# EAGLE design xport-v92-linetestset (EAGLE 9.6.2)
Isolated Line Test Set: A lineman's test handset: polarity-independent, line powered, with an isolated 600:600 wet transformer and switchable TALK / MONITOR loading.
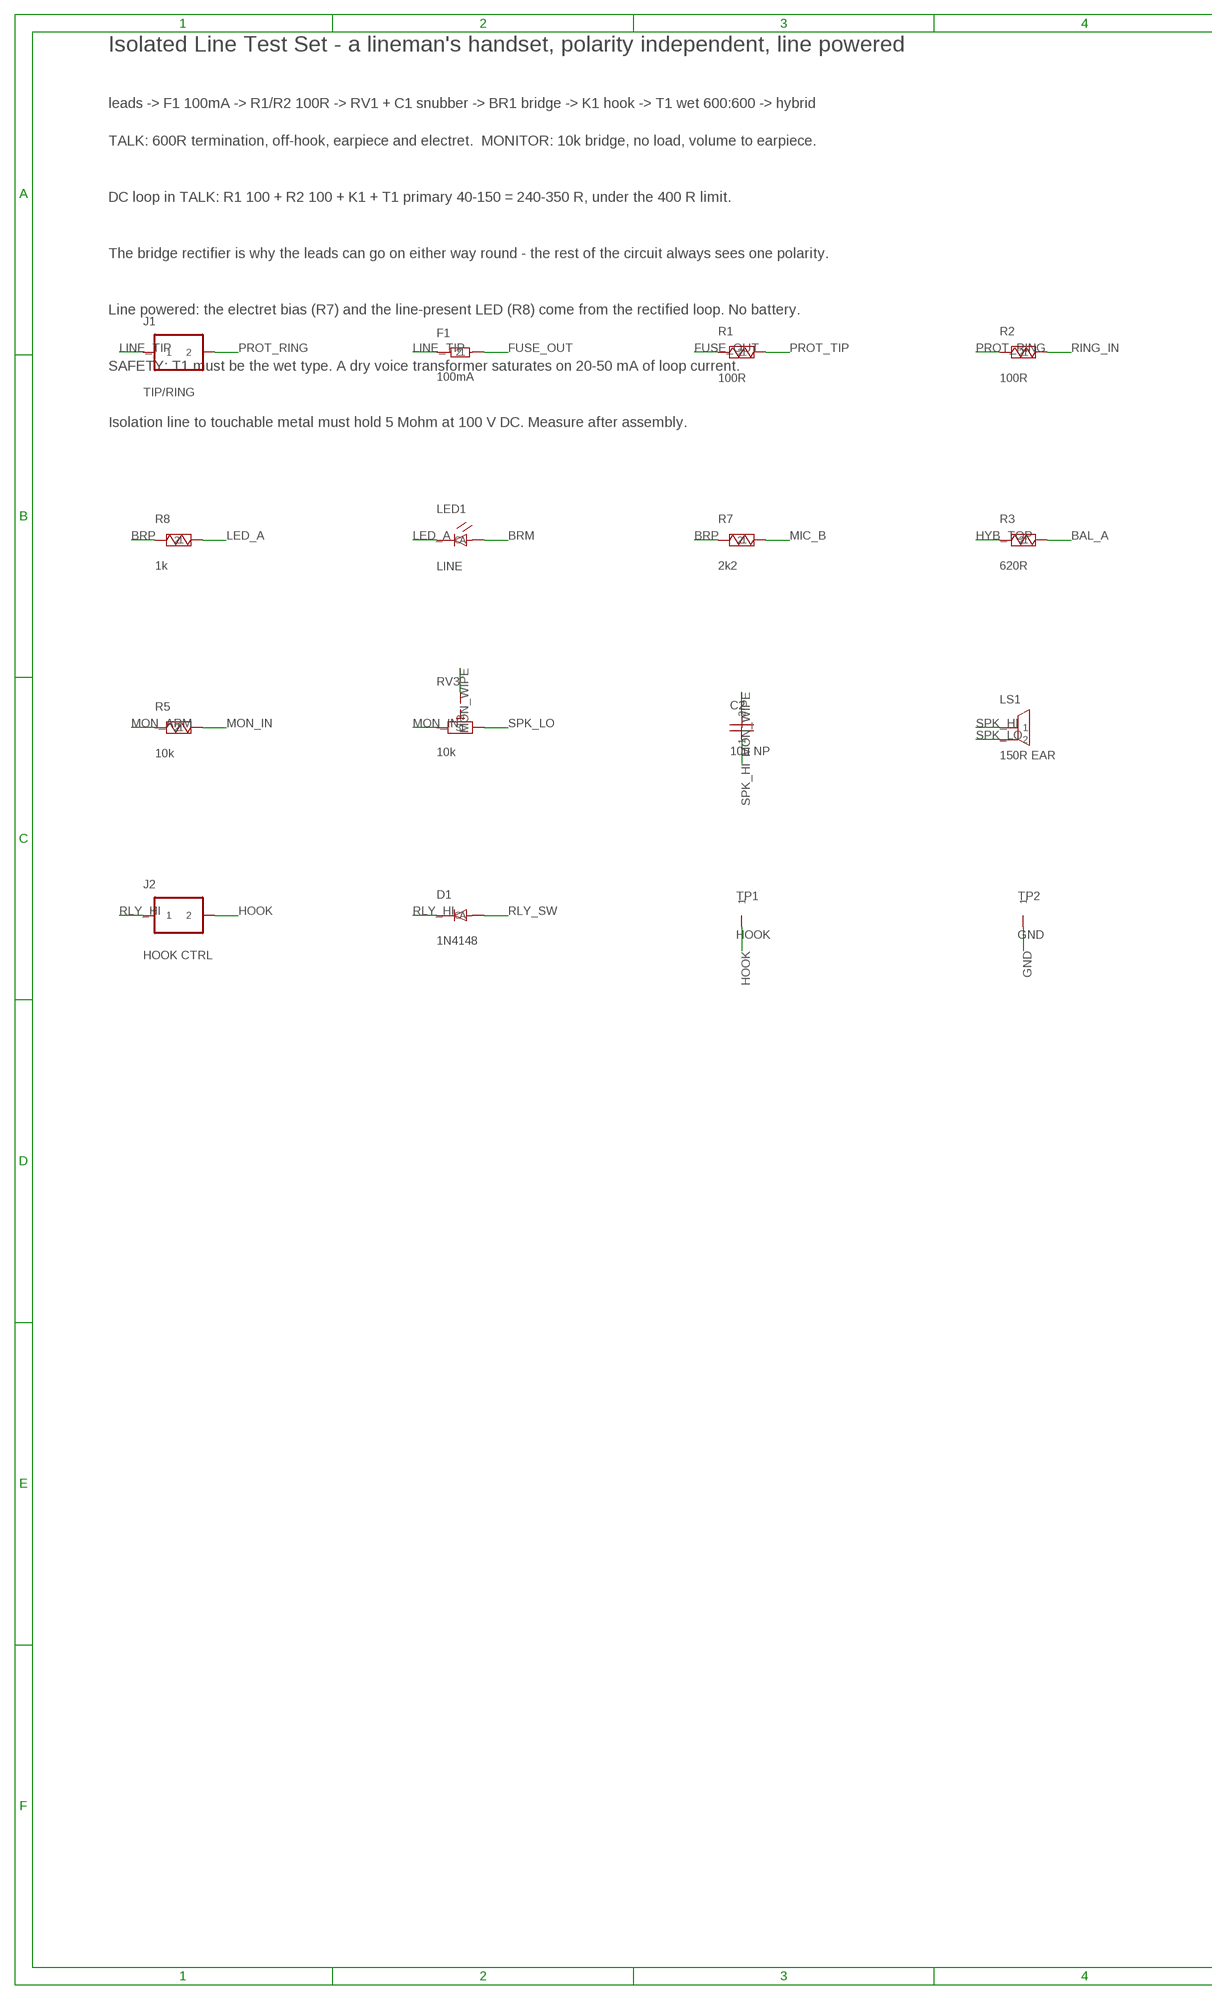
[diagram p0: schematic, sheet 1, part 1 of 2]
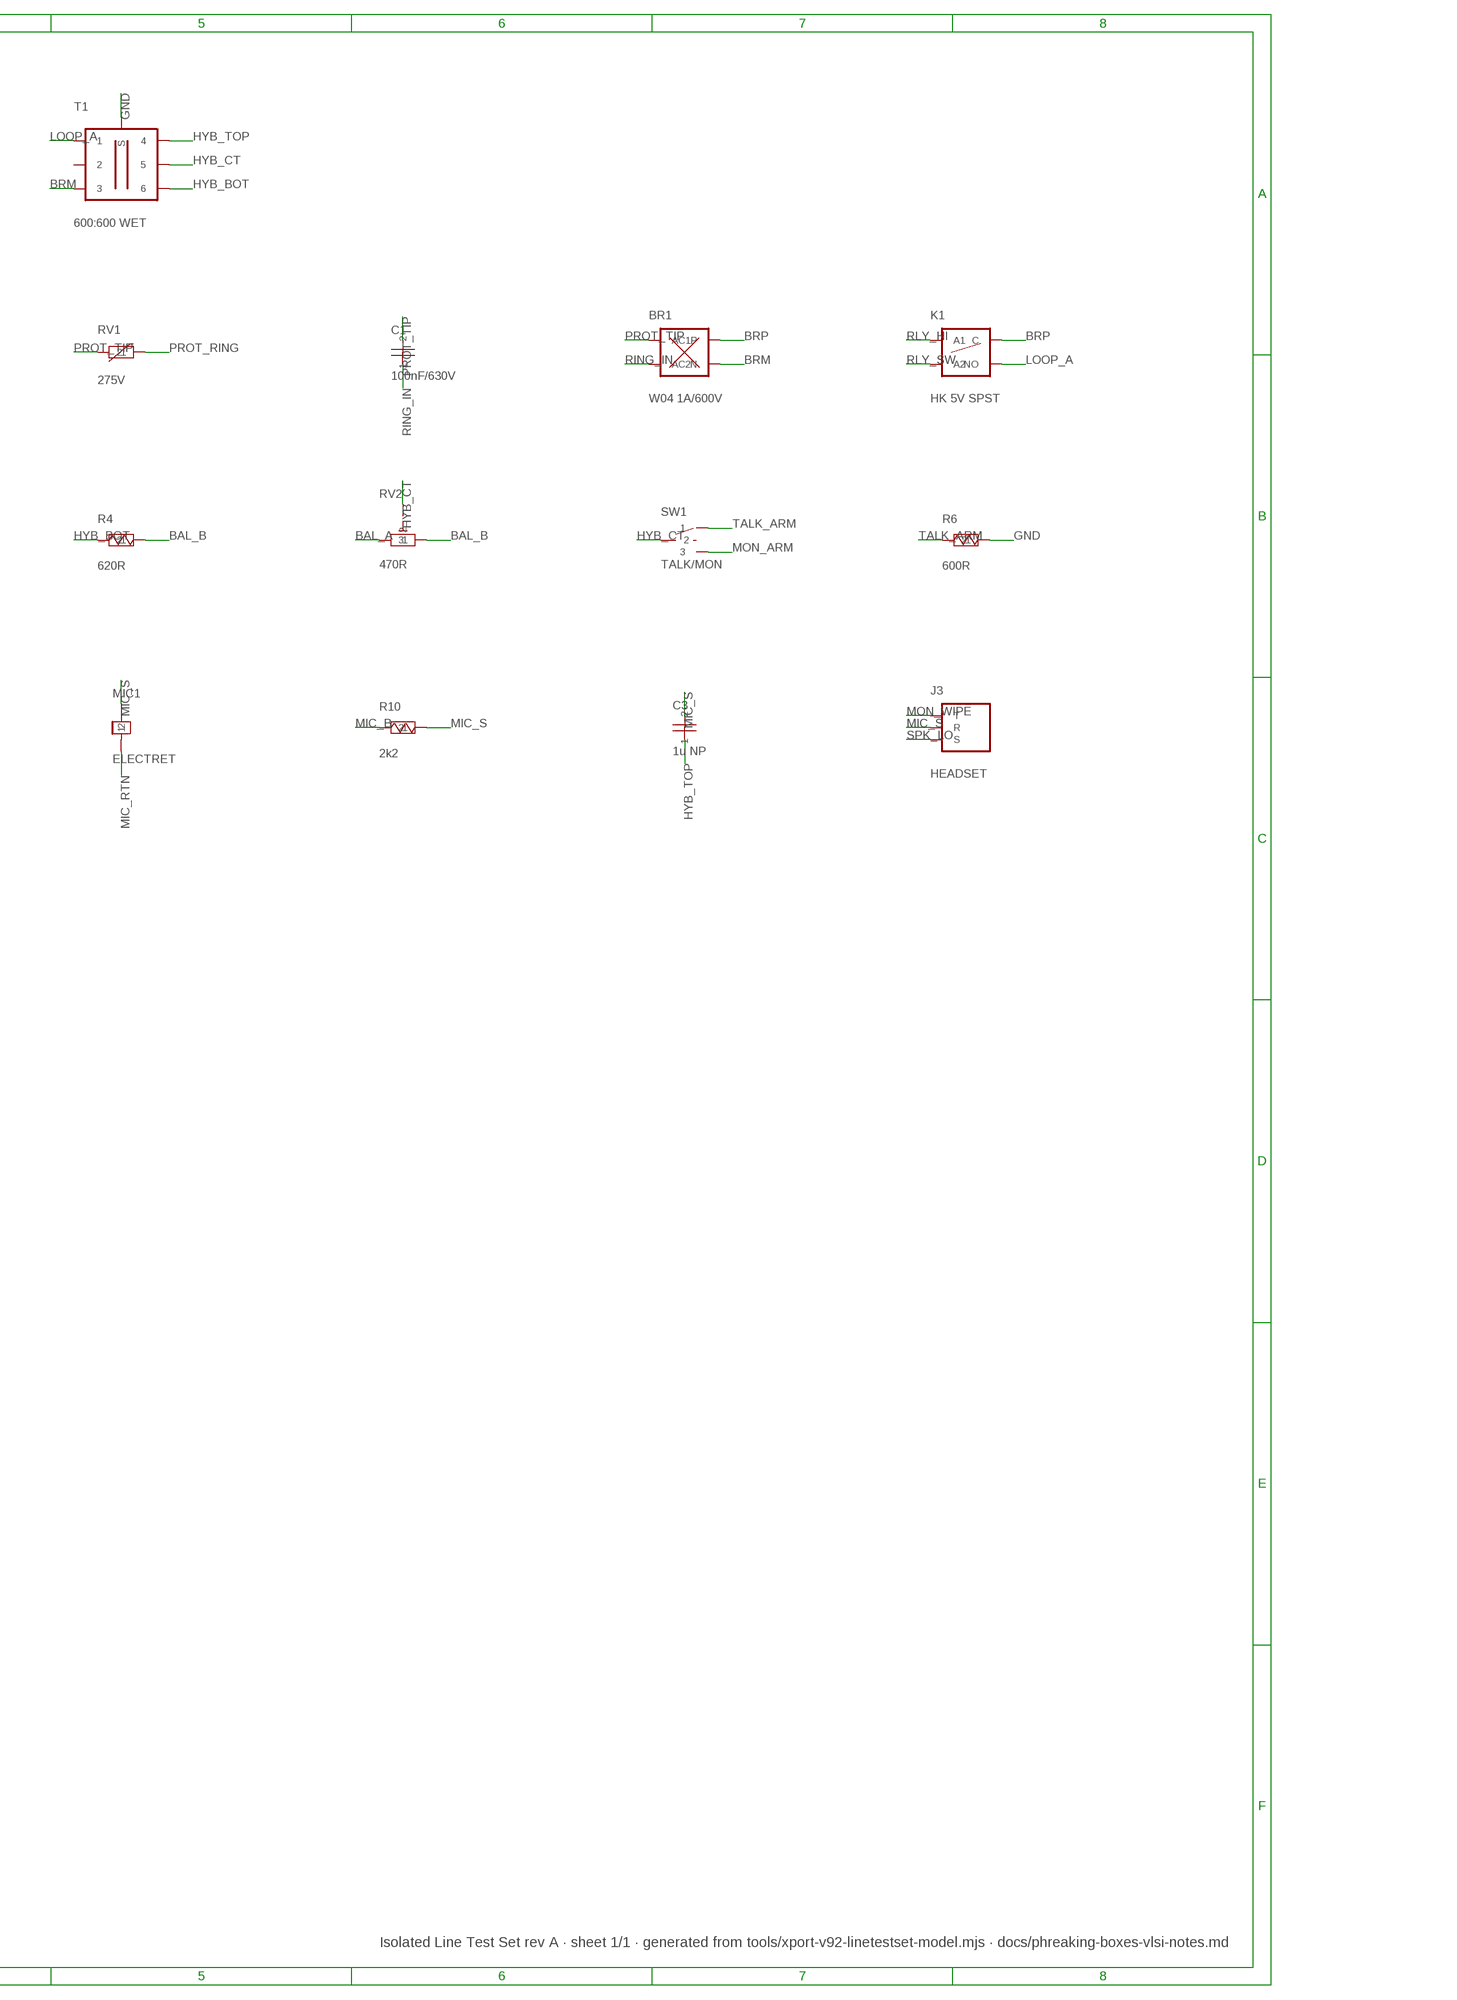
[diagram p1: schematic, sheet 1, part 2 of 2]

## Parts
BR1  W04 1A/600V  BRIDGE  [BRIDGE-WOB]
C1  100nF/630V  C-EU  [C-5.08]
C2  10u NP  C-EU  [C-5.08]
C3  1u NP  C-EU  [C-5.08]
D1  1N4148  DIODE-SCH  [DO41]
F1  100mA  FUSE  [R-7.62]
J1  TIP/RING  TERM-2  [TERM2-5.08]
J2  HOOK CTRL  TERM-2  [TERM2-5.08]
J3  HEADSET  JACK-TRS  [JACK-3P5]
K1  HK 5V SPST  RELAY  [RELAY-SPST]
LED1  LINE  LED  [LED-5MM]
LS1  150R EAR  SPEAKER  [SPEAKER-12]
MIC1  ELECTRET  [ELECTRET-10]
R1  100R  R-EU  [R-7.62]
R2  100R  R-EU  [R-7.62]
R3  620R  R-EU  [R-7.62]
R4  620R  R-EU  [R-7.62]
R5  10k  R-EU  [R-7.62]
R6  600R  R-EU  [R-7.62]
R7  2k2  R-EU  [R-7.62]
R8  1k  R-EU  [R-7.62]
R10  2k2  R-EU  [R-7.62]
RV1  275V  VARISTOR  [MOV-7.62]
RV2  470R  TRIM  [TRIM-3P]
RV3  10k  TRIM  [TRIM-3P]
SW1  TALK/MON  SW-SPDT  [TOGGLE-SPDT]
T1  600:600 WET  XFMR-600  [XFMR-600]
TP1  HOOK  TP  [TP]
TP2  GND  TP  [TP]

## Nets
BAL_A: R3.2 RV2.1
BAL_B: R4.2 RV2.3
BRM: BR1.-(N) LED1.2(C) T1.3
BRP: BR1.+(P) K1.3(C) R7.1 R8.1
FUSE_OUT: F1.2 R1.1
GND: R6.2 T1.S TP2.1
HOOK: J2.2 TP1.1
HYB_BOT: R4.1 T1.6
HYB_CT: RV2.2 SW1.2 T1.5
HYB_TOP: C3.2 R3.1 T1.4
LED_A: LED1.1(A) R8.2
LINE_TIP: F1.1 J1.1
LOOP_A: K1.4(NO) T1.1
MIC_B: R7.2 R10.1
MIC_RTN: MIC1.2
MIC_S: C3.1 J3.2(R) MIC1.1 R10.2
MON_ARM: R5.1 SW1.3
MON_IN: R5.2 RV3.1
MON_WIPE: C2.1 J3.1(T) RV3.2
PROT_RING: J1.2 R2.1 RV1.2
PROT_TIP: BR1.~1(AC1) C1.1 R1.2 RV1.1
RING_IN: BR1.~2(AC2) C1.2 R2.2
RLY_HI: D1.1(A) J2.1 K1.1(A1)
RLY_SW: D1.2(C) K1.2(A2)
SPK_HI: C2.2 LS1.1
SPK_LO: J3.3(S) LS1.2 RV3.3
TALK_ARM: R6.1 SW1.1
Unconnected: T1.2

## Notes on the sheet
- Isolated Line Test Set - a lineman's handset, polarity independent, line powered
- leads -> F1 100mA -> R1/R2 100R -> RV1 + C1 snubber -> BR1 bridge -> K1 hook -> T1 wet 600:600 -> hybrid
- TALK: 600R termination, off-hook, earpiece and electret.  MONITOR: 10k bridge, no load, volume to earpiece.
- DC loop in TALK: R1 100 + R2 100 + K1 + T1 primary 40-150 = 240-350 R, under the 400 R limit.
- The bridge rectifier is why the leads can go on either way round - the rest of the circuit always sees one polarity.
- Line powered: the electret bias (R7) and the line-present LED (R8) come from the rectified loop. No battery.
- SAFETY: T1 must be the wet type. A dry voice transformer saturates on 20-50 mA of loop current.
- Isolation line to touchable metal must hold 5 Mohm at 100 V DC. Measure after assembly.
- Isolated Line Test Set rev A · sheet 1/1 · generated from tools/xport-v92-linetestset-model.mjs · docs/phreaking-boxes-vlsi-notes.md

## Library data of the parts
BR1 = xport-v92-linetestset:BRIDGE
C1-C3 = xport-v92-linetestset:C-EU
D1 = xport-v92-linetestset:DIODE-SCH
F1 = xport-v92-linetestset:FUSE
J1 J2 = xport-v92-linetestset:TERM-2
J3 = xport-v92-linetestset:JACK-TRS
K1 = xport-v92-linetestset:RELAY
LED1 = xport-v92-linetestset:LED
LS1 = xport-v92-linetestset:SPEAKER
MIC1 = xport-v92-linetestset:ELECTRET
R1-R8 R10 = xport-v92-linetestset:R-EU
RV1 = xport-v92-linetestset:VARISTOR
RV2 RV3 = xport-v92-linetestset:TRIM
SW1 = xport-v92-linetestset:SW-SPDT
T1 = xport-v92-linetestset:XFMR-600
TP1 TP2 = xport-v92-linetestset:TP

## Net classes
0 default: width 0.305 mm
1 mains: width 2.5 mm, clearance 3 mm to class 0, clearance 3 mm, clearance 3 mm to class 2
2 power: width 1 mm, clearance 0.5 mm to class 0, clearance 0.6 mm

## Board
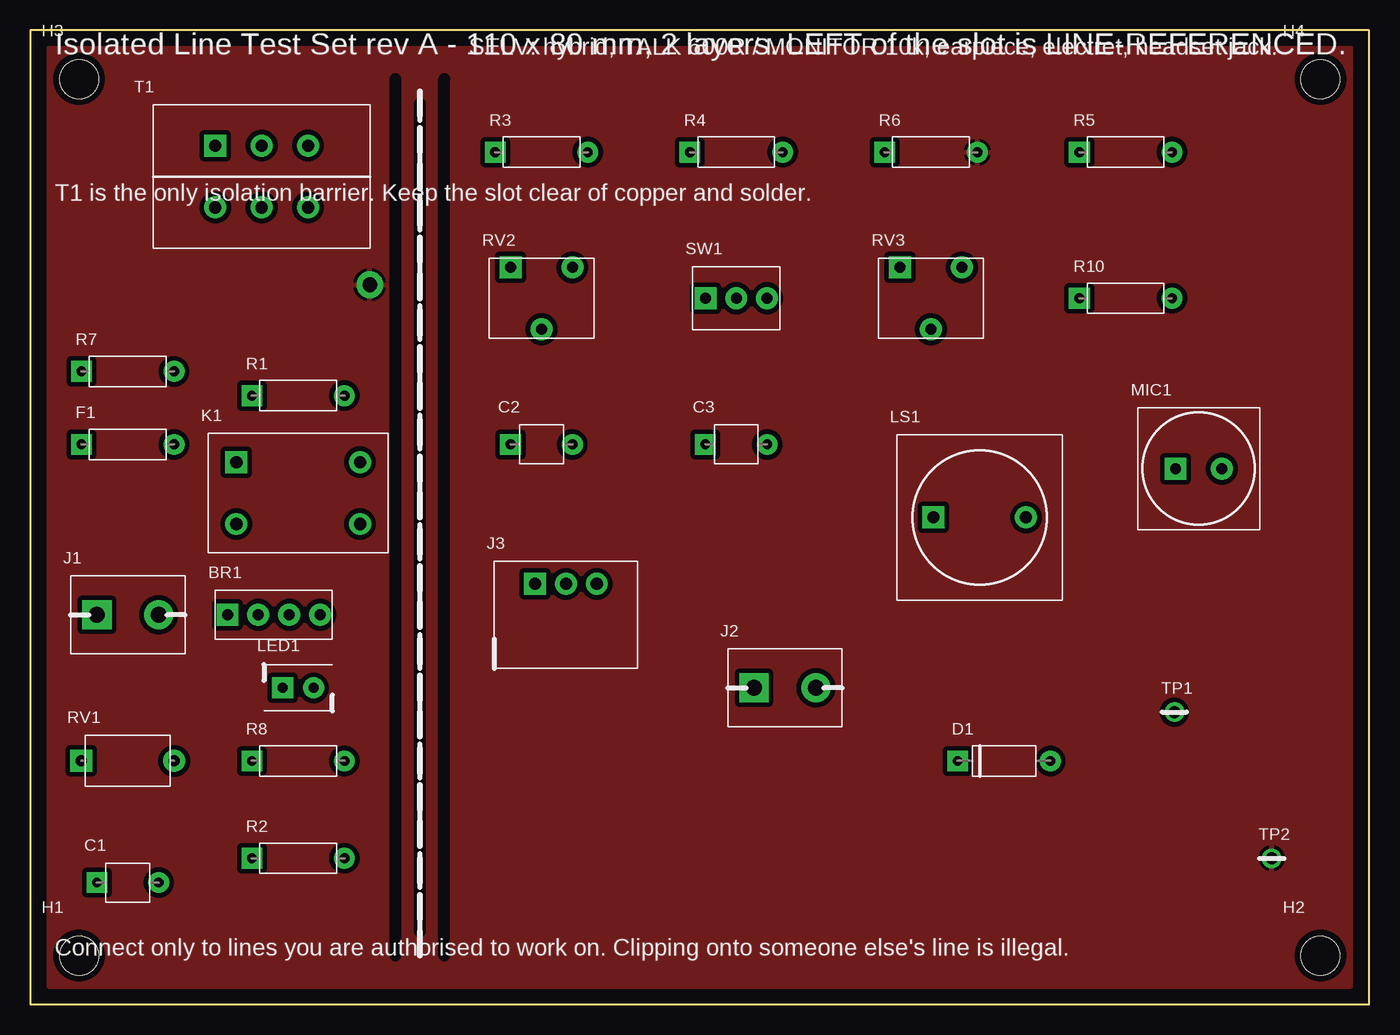
[diagram p2: board, top side]
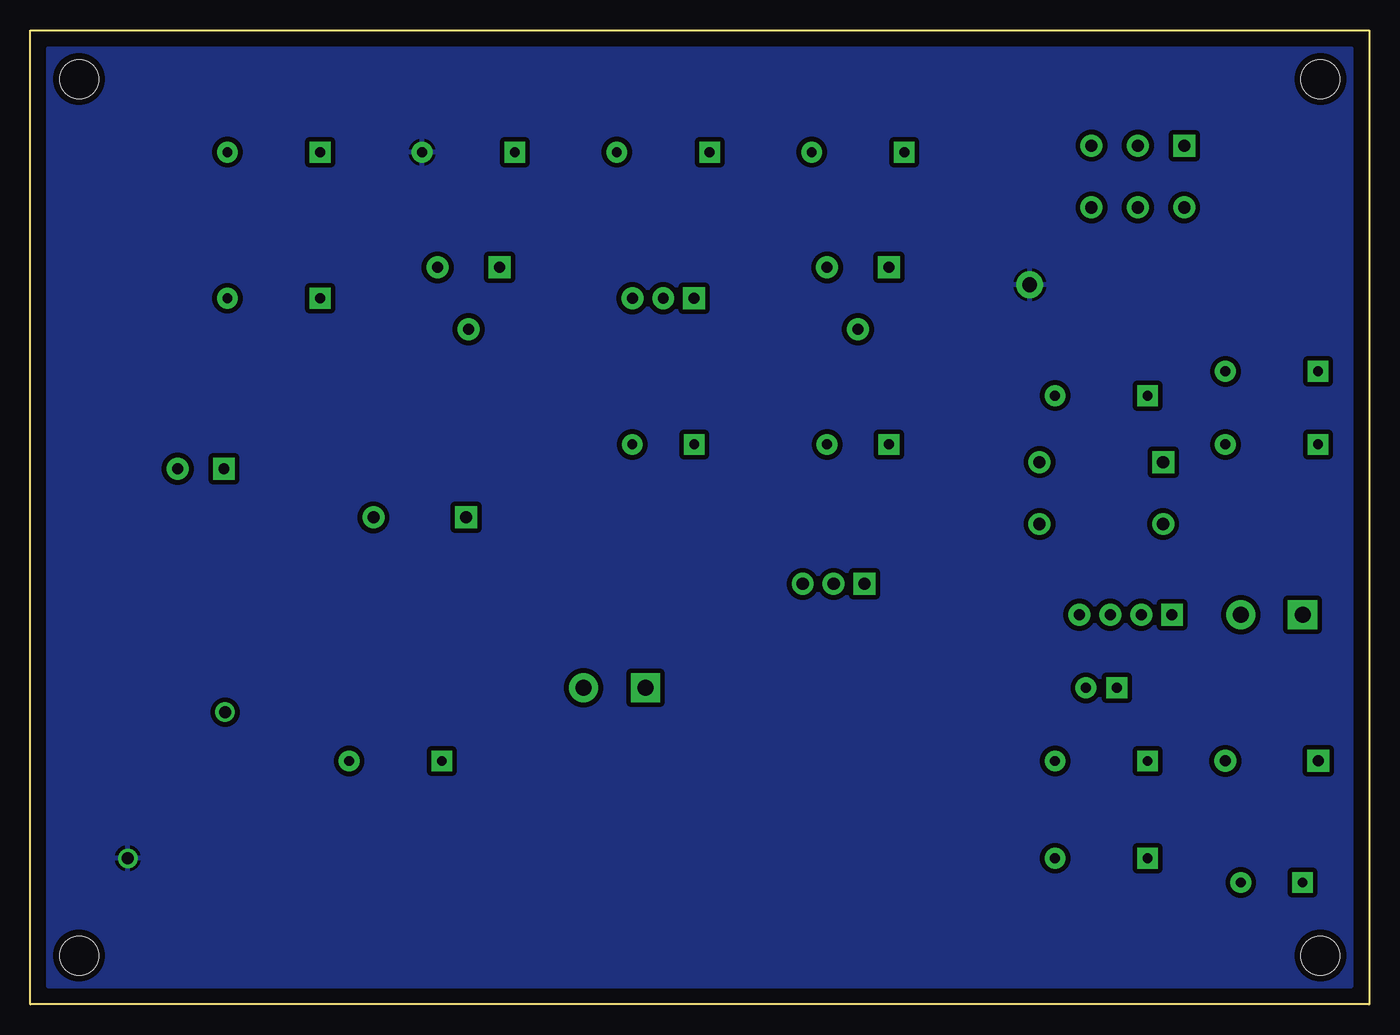
[diagram p3: board, bottom side, seen from below]

Size 110 x 80 mm. Coordinates in mm from the lower left corner, seen from the top.
Outline: 0,0 110,0 110,80 0,80 0,0
Copper layers (1*16): Top 0.035mm / dielectric 1.5mm / Bottom 0.035mm
Design rules "xport-v92-linetestset-2layer": minimum track width 8mil, minimum drill 0.35mm, track to track 8mil, track to pad 8mil, pad to pad 8mil, via to via 8mil, smd to smd 0mil, copper to edge 20mil, drill to drill 8mil, minimum pad ring 10mil, minimum via ring 8mil, stop-mask expansion 4mil, vias tented up to drill 25mil, thermal gap 10mil
tRestrict: 3 lines

### Footprints (pad centres in the part's own frame; a part is rotated, then mirrored left to right if it is on the bottom)
BRIDGE-WOB = drill 0.9 pad 1.8: + 1.27,0; - 3.81,0; ~2 -1.27,0 | drill 0.9 pad 1.8 square: ~1 -3.81,0
C-5.08 = drill 0.8 pad 1.7 square: 1 -2.54,0 | drill 0.8 pad 1.7: 2 2.54,0
DO41 = drill 0.8 pad 1.7 square: 1 -3.81,0 | drill 0.8 pad 1.7: 2 3.81,0
R-7.62 = drill 0.8 pad 1.7 square: 1 -3.81,0 | drill 0.8 pad 1.7: 2 3.81,0
MOUNT-M3 = hole 3.2: 0,0
TERM2-5.08 = drill 1.3 pad 2.4 square: 1 -2.54,0 | drill 1.3 pad 2.4: 2 2.54,0
JACK-3P5 = drill 1 pad 1.8 square: 1 -2.54,2.54 | drill 1 pad 1.8: 2 0,2.54; 3 2.54,2.54
RELAY-SPST = drill 1 pad 1.8 square: 1 -5.08,2.54 | drill 1 pad 1.8: 2 -5.08,-2.54; 3 5.08,2.54; 4 5.08,-2.54
LED-5MM = drill 0.8 pad 1.7 square: 1 -1.27,0 | drill 0.8 pad 1.7: 2 1.27,0
SPEAKER-12 = drill 1 pad 1.8 square: 1 -3.81,0 | drill 1 pad 1.8: 2 3.81,0
ELECTRET-10 = drill 0.9 pad 1.8 square: 1 -1.9,0 | drill 0.9 pad 1.8: 2 1.9,0
MOV-7.62 = drill 0.9 pad 1.8 square: 1 -3.81,0 | drill 0.9 pad 1.8: 2 3.81,0
TRIM-3P = drill 0.9 pad 1.8 square: 1 -2.54,2.54 | drill 0.9 pad 1.8: 2 0,-2.54; 3 2.54,2.54
TOGGLE-SPDT = drill 0.9 pad 1.8 square: 1 -2.54,0 | drill 0.9 pad 1.8: 2 0,0; 3 2.54,0
XFMR-600 = drill 1 pad 1.8 square: 1 -3.81,2.54 | drill 1 pad 1.8: 2 0,2.54; 3 3.81,2.54; 4 3.81,-2.54; 5 0,-2.54; 6 -3.81,-2.54 | drill 1.2 pad 2.2: S 8.89,-8.89
TP = drill 1 pad 1.6: 1 0,0

### Placement (x,y rotation side)
BR1  20,32 0 top
C1  8,10 0 top
C2  42,46 0 top
C3  58,46 0 top
D1  80,20 0 top
F1  8,46 0 top
H1  [MOUNT-M3]  4,4 0 top
H2  [MOUNT-M3]  106,4 0 top
H3  [MOUNT-M3]  4,76 0 top
H4  [MOUNT-M3]  106,76 0 top
J1  8,32 0 top
J2  62,26 0 top
J3  44,32 0 top
K1  22,42 0 top
LED1  22,26 0 top
LS1  78,40 0 top
MIC1  96,44 0 top
R1  22,50 0 top
R2  22,12 0 top
R3  42,70 0 top
R4  58,70 0 top
R5  90,70 0 top
R6  74,70 0 top
R7  8,52 0 top
R8  22,20 0 top
R10  90,58 0 top
RV1  8,20 0 top
RV2  42,58 0 top
RV3  74,58 0 top
SW1  58,58 0 top
T1  19,68 0 top
TP1  94,24 0 top
TP2  102,12 0 top

### Tracks (layer width: path | path; a pad name or v marks a point on that pad's centre or on a via)
GND
  pour Top (isolate 0.4, rank 2): 1.5,1.5 108.5,1.5 108.5,78.5 1.5,78.5
  pour Bottom (isolate 0.4, rank 2): 1.5,1.5 108.5,1.5 108.5,78.5 1.5,78.5

### Text on the board
tPlace: Isolated Line Test Set rev A - 110 x 80 mm, 2 layers. LEFT of the slot is LINE-REFERENCED. | SELV: hybrid, TALK 600R / MONITOR 10k, earpiece, electret, headset jack. | T1 is the only isolation barrier. Keep the slot clear of copper and solder. | Connect only to lines you are authorised to work on. Clipping onto someone else's line is illegal.